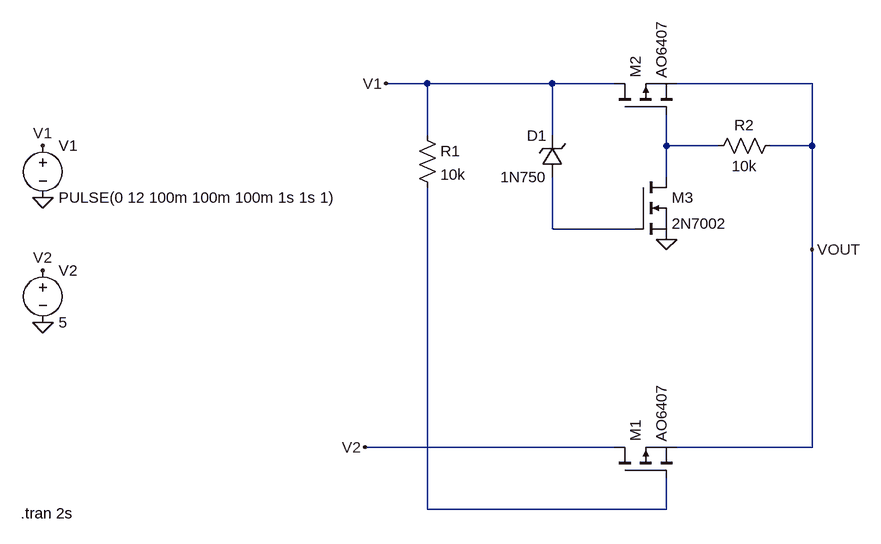
[diagram p0: schematic power_switch.asc]
power_switch.asc, the LTspice schematic file:
Version 4
SHEET 1 1216 680
WIRE 576 -32 512 -32
WIRE 768 -32 576 -32
WIRE 864 -32 768 -32
WIRE 1168 -32 960 -32
WIRE 576 48 576 -32
WIRE 768 48 768 -32
WIRE 944 64 944 16
WIRE 1024 64 944 64
WIRE 1168 64 1168 -32
WIRE 1168 64 1104 64
WIRE 944 112 944 64
WIRE 768 192 768 112
WIRE 896 192 768 192
WIRE 1168 224 1168 64
WIRE 864 528 480 528
WIRE 1168 528 1168 224
WIRE 1168 528 960 528
WIRE 576 624 576 128
WIRE 944 624 944 576
WIRE 944 624 576 624
FLAG -16 144 0
FLAG -16 336 0
FLAG -16 64 V1
FLAG -16 256 V2
FLAG 944 208 0
FLAG 1168 224 VOUT
FLAG 512 -32 V1
FLAG 480 528 V2
SYMBOL voltage -16 48 R0
WINDOW 123 0 0 Left 0
WINDOW 39 0 0 Left 0
SYMATTR InstName V1
SYMATTR Value PULSE(0 12 100m 100m 100m 1s 1s 1)
SYMBOL voltage -16 240 R0
WINDOW 123 0 0 Left 0
WINDOW 39 0 0 Left 0
SYMATTR InstName V2
SYMATTR Value 5
SYMBOL res 560 32 R0
SYMATTR InstName R1
SYMATTR Value 10k
SYMBOL res 1120 48 R90
WINDOW 0 0 56 VBottom 2
WINDOW 3 32 56 VTop 2
SYMATTR InstName R2
SYMATTR Value 10k
SYMBOL pmos 864 576 R270
SYMATTR InstName M1
SYMATTR Value AO6407
SYMBOL pmos 864 16 R270
SYMATTR InstName M2
SYMATTR Value AO6407
SYMBOL nmos 896 112 R0
SYMATTR InstName M3
SYMATTR Value 2N7002
SYMBOL zener 784 112 R180
WINDOW 0 24 64 Left 2
WINDOW 3 24 0 Left 2
SYMATTR InstName D1
SYMATTR Value 1N750
SYMATTR Description Diode
SYMATTR Type diode
TEXT -50 630 Left 2 !.tran 2s

The netlist it stands for:
* power_switch.asc
V1 V1 0 PULSE(0 12 100m 100m 100m 1s 1s 1)
V2 V2 0 5
R1 V1 N003 10k
R2 VOUT N001 10k
M1 V2 N003 VOUT VOUT AO6407
M2 V1 N001 VOUT VOUT AO6407
M3 N001 N002 0 0 2N7002
D1 N002 V1 1N750
.model D D
.lib standard.dio
.model NMOS NMOS
.model PMOS PMOS
.lib standard.mos
.tran 2s
.backanno
.end